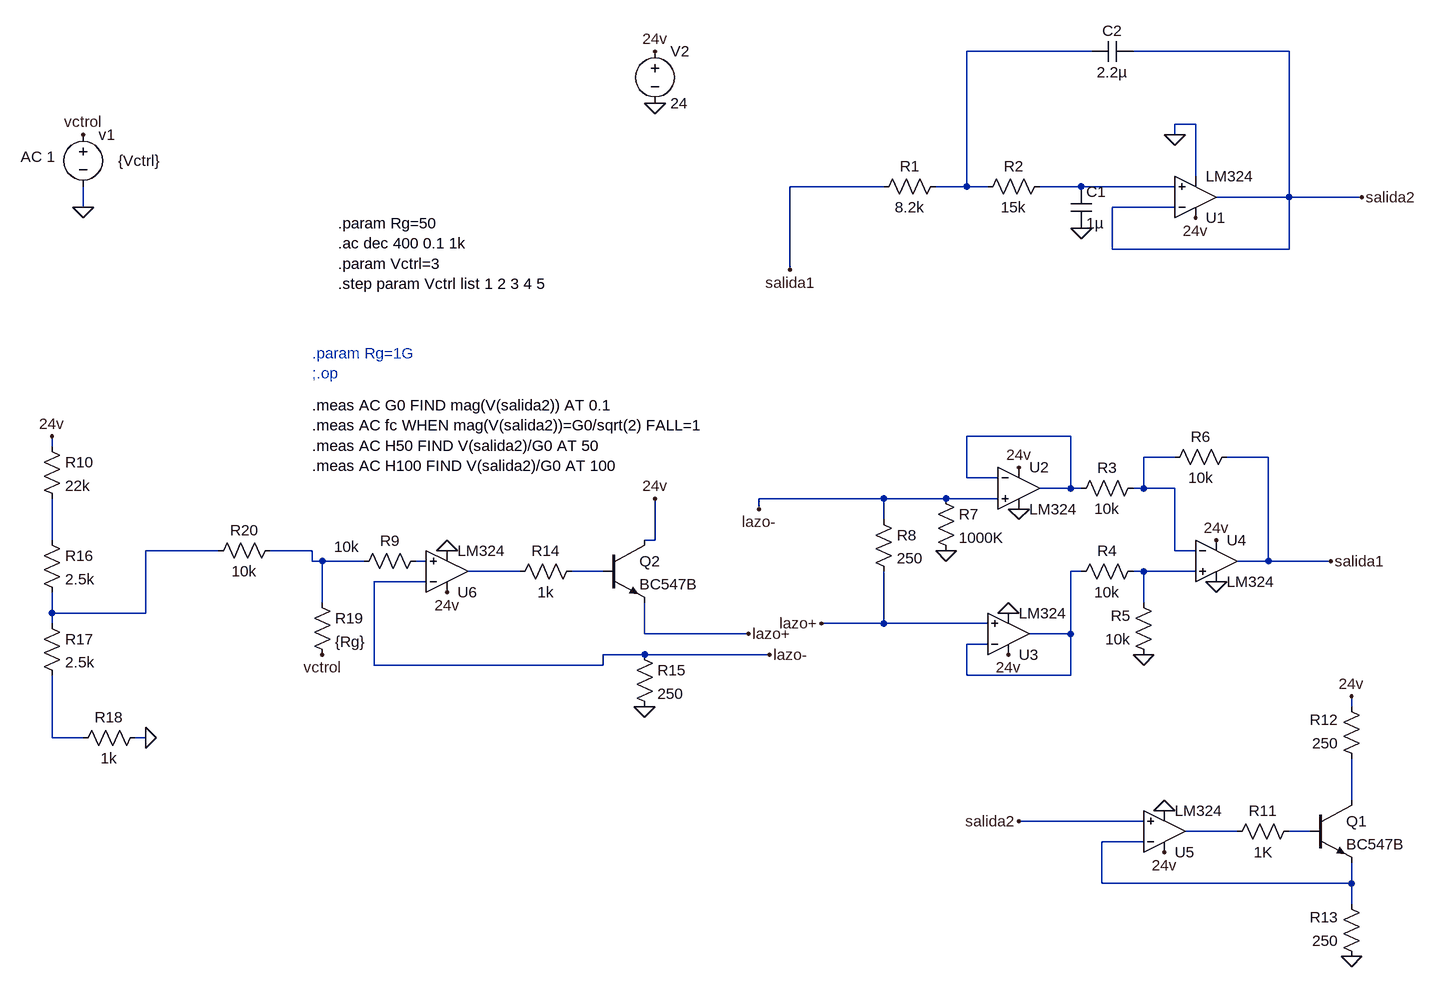
[diagram p0: schematic Filtro_Senal_Campo_Grupo2.asc]
Filtro_Senal_Campo_Grupo2.asc, the LTspice schematic file:
Version 4.1
SHEET 1 1044 1172
WIRE 528 -240 336 -240
WIRE 832 -240 592 -240
WIRE 688 -128 656 -128
WIRE 656 -112 656 -128
WIRE 688 -48 688 -128
WIRE 208 -32 64 -32
WIRE 336 -32 336 -240
WIRE 336 -32 288 -32
WIRE 368 -32 336 -32
WIRE 512 -32 448 -32
WIRE 656 -32 512 -32
WIRE 832 -16 832 -240
WIRE 832 -16 720 -16
WIRE 944 -16 832 -16
WIRE -1024 0 -1024 -32
WIRE 656 0 560 0
WIRE 560 64 560 0
WIRE 832 64 832 -16
WIRE 832 64 560 64
WIRE 64 96 64 -32
WIRE 496 352 336 352
WIRE -1072 368 -1072 352
WIRE 656 384 608 384
WIRE 800 384 736 384
WIRE 336 416 336 352
WIRE 384 416 336 416
WIRE 496 432 496 352
WIRE 496 432 448 432
WIRE 512 432 496 432
WIRE 608 432 608 384
WIRE 608 432 592 432
WIRE 656 432 608 432
WIRE 208 448 16 448
WIRE 304 448 208 448
WIRE 384 448 304 448
WIRE 16 464 16 448
WIRE 208 480 208 448
WIRE -1072 512 -1072 448
WIRE -144 512 -144 448
WIRE -144 512 -160 512
WIRE -816 528 -928 528
WIRE -672 528 -736 528
WIRE 656 528 656 432
WIRE 688 528 656 528
WIRE -672 544 -672 528
WIRE -656 544 -672 544
WIRE -592 544 -656 544
WIRE -496 544 -512 544
WIRE 800 544 800 384
WIRE 800 544 752 544
WIRE 896 544 800 544
WIRE -352 560 -432 560
WIRE -224 560 -272 560
WIRE 512 560 496 560
WIRE 608 560 592 560
WIRE 688 560 608 560
WIRE -496 576 -576 576
WIRE -656 608 -656 544
WIRE 608 608 608 560
WIRE -1072 624 -1072 592
WIRE -928 624 -928 528
WIRE -928 624 -1072 624
WIRE -1072 640 -1072 624
WIRE 208 640 208 560
WIRE 208 640 112 640
WIRE 368 640 208 640
WIRE -160 656 -160 608
WIRE 0 656 -160 656
WIRE 496 656 496 560
WIRE 496 656 432 656
WIRE 368 672 336 672
WIRE -160 688 -224 688
WIRE 32 688 -160 688
WIRE -576 704 -576 576
WIRE -224 704 -224 688
WIRE -224 704 -576 704
WIRE 336 720 336 672
WIRE 496 720 496 656
WIRE 496 720 336 720
WIRE 928 768 928 752
WIRE -1072 816 -1072 720
WIRE -1024 816 -1072 816
WIRE -928 816 -944 816
WIRE 928 912 928 848
WIRE 608 944 416 944
WIRE 752 960 672 960
WIRE 864 960 832 960
WIRE 608 976 544 976
WIRE 544 1040 544 976
WIRE 928 1040 928 1008
WIRE 928 1040 544 1040
WIRE 928 1072 928 1040
FLAG 512 32 0
FLAG 656 -112 0
FLAG -144 -160 0
FLAG -144 -240 24v
FLAG 688 16 24v
FLAG 304 528 0
FLAG 896 544 salida1
FLAG 944 -16 salida2
FLAG 416 400 24v
FLAG 400 688 24v
FLAG 720 512 24v
FLAG 416 464 0
FLAG 400 624 0
FLAG 720 576 0
FLAG 64 96 salida1
FLAG 608 688 0
FLAG 928 752 24v
FLAG 416 944 salida2
FLAG 928 1152 0
FLAG 640 928 0
FLAG 640 992 24v
FLAG -144 448 24v
FLAG -464 528 0
FLAG -464 592 24v
FLAG -160 768 0
FLAG 0 656 lazo+
FLAG 112 640 lazo+
FLAG 32 688 lazo-
FLAG 16 464 lazo-
FLAG -1024 0 0
FLAG -1024 -112 vctrol
FLAG -928 816 0
FLAG -1072 352 24v
FLAG -656 688 vctrol
SYMBOL res 304 -48 R90
WINDOW 0 0 56 VBottom 2
WINDOW 3 32 56 VTop 2
SYMATTR InstName R1
SYMATTR Value 8.2k
SYMBOL res 352 -16 R270
WINDOW 0 32 56 VTop 2
WINDOW 3 0 56 VBottom 2
SYMATTR InstName R2
SYMATTR Value 15k
SYMBOL cap 496 -32 R0
SYMATTR InstName C1
SYMATTR Value 1µ
SYMBOL cap 592 -256 R90
WINDOW 0 0 32 VBottom 2
WINDOW 3 32 32 VTop 2
SYMATTR InstName C2
SYMATTR Value 2.2µ
SYMBOL OpAmps\\LM324 688 48 M180
SYMATTR InstName U1
SYMBOL voltage -144 -256 R0
WINDOW 123 0 0 Left 0
WINDOW 39 0 0 Left 0
SYMATTR InstName V2
SYMATTR Value 24
SYMBOL OpAmps\\LM324 416 368 R0
SYMATTR InstName U2
SYMBOL OpAmps\\LM324 400 720 M180
SYMATTR InstName U3
SYMBOL OpAmps\\LM324 720 480 R0
SYMATTR InstName U4
SYMBOL res 608 416 R90
WINDOW 0 0 56 VBottom 2
WINDOW 3 32 56 VTop 2
SYMATTR InstName R3
SYMATTR Value 10k
SYMBOL res 608 544 R90
WINDOW 0 0 56 VBottom 2
WINDOW 3 32 56 VTop 2
SYMATTR InstName R4
SYMATTR Value 10k
SYMBOL res 624 704 R180
WINDOW 0 36 76 Left 2
WINDOW 3 36 40 Left 2
SYMATTR InstName R5
SYMATTR Value 10k
SYMBOL res 640 400 R270
WINDOW 0 32 56 VTop 2
WINDOW 3 0 56 VBottom 2
SYMATTR InstName R6
SYMATTR Value 10k
SYMBOL res 288 432 R0
SYMATTR InstName R7
SYMATTR Value 1000K
SYMBOL res 192 464 R0
SYMATTR InstName R8
SYMATTR Value 250
SYMBOL OpAmps\\LM324 640 1024 M180
SYMATTR InstName U5
SYMBOL res 848 944 R90
WINDOW 0 0 56 VBottom 2
WINDOW 3 32 56 VTop 2
SYMATTR InstName R11
SYMATTR Value 1K
SYMBOL res 944 864 R180
WINDOW 0 36 76 Left 2
WINDOW 3 36 40 Left 2
SYMATTR InstName R12
SYMATTR Value 250
SYMBOL res 944 1168 R180
WINDOW 0 36 76 Left 2
WINDOW 3 36 40 Left 2
SYMATTR InstName R13
SYMATTR Value 250
SYMBOL npn 864 912 R0
SYMATTR InstName Q1
SYMATTR Value BC547B
SYMBOL OpAmps\\LM324 -464 624 M180
SYMATTR InstName U6
SYMBOL res -256 544 R90
WINDOW 0 0 56 VBottom 2
WINDOW 3 32 56 VTop 2
SYMATTR InstName R14
SYMATTR Value 1k
SYMBOL npn -224 512 R0
SYMATTR InstName Q2
SYMATTR Value BC547B
SYMBOL res -176 672 R0
SYMATTR InstName R15
SYMATTR Value 250
SYMBOL voltage -1024 -128 R0
WINDOW 3 54 56 Left 2
WINDOW 123 -96 50 Left 2
WINDOW 39 0 0 Left 0
SYMATTR InstName v1
SYMATTR Value {Vctrl}
SYMATTR Value2 AC 1
SYMBOL res -496 528 R90
WINDOW 0 0 56 VBottom 2
WINDOW 3 -22 122 VTop 2
SYMATTR InstName R9
SYMATTR Value 10k
SYMBOL res -1088 352 R0
SYMATTR InstName R10
SYMATTR Value 22k
SYMBOL res -1088 496 R0
SYMATTR InstName R16
SYMATTR Value 2.5k
SYMBOL res -1088 624 R0
SYMATTR InstName R17
SYMATTR Value 2.5k
SYMBOL res -928 800 R90
WINDOW 0 0 56 VBottom 2
WINDOW 3 32 56 VTop 2
SYMATTR InstName R18
SYMATTR Value 1k
SYMBOL res -672 592 R0
SYMATTR InstName R19
SYMATTR Value {Rg}
SYMBOL res -720 512 R90
WINDOW 0 0 56 VBottom 2
WINDOW 3 32 56 VTop 2
SYMATTR InstName R20
SYMATTR Value 10k
TEXT -632 24 Left 2 !.param Rg=50\n.ac dec 400 0.1 1k\n.param Vctrl=3\n.step param Vctrl list 1 2 3 4 5
TEXT -672 304 Left 2 !.meas AC G0 FIND mag(V(salida2)) AT 0.1\n.meas AC fc WHEN mag(V(salida2))=G0/sqrt(2) FALL=1\n.meas AC H50 FIND V(salida2)/G0 AT 50\n.meas AC H100 FIND V(salida2)/G0 AT 100
TEXT -672 224 Left 2 ;.param Rg=1G\n;.op

The netlist it stands for:
* Filtro_Senal_Campo_Grupo2.asc
R1 N001 salida1 8.2k
R2 N001 N002 15k
C1 N002 0 1µ
C2 salida2 N001 2.2µ
X§U1 N002 salida2 24v 0 salida2 LM324  ; pins In+ In- V+ V- OUT
V2 24v 0 24
X§U2 lazo- N003 24v 0 N003 LM324  ; pins In+ In- V+ V- OUT
X§U3 lazo+ N011 24v 0 N011 LM324  ; pins In+ In- V+ V- OUT
X§U4 N012 N004 24v 0 salida1 LM324  ; pins In+ In- V+ V- OUT
R3 N004 N003 10k
R4 N012 N011 10k
R5 0 N012 10k
R6 N004 salida1 10k
R7 lazo- 0 1000K
R8 lazo- lazo+ 250
X§U5 salida2 N017 24v 0 N015 LM324  ; pins In+ In- V+ V- OUT
R11 N016 N015 1K
R12 N014 24v 250
R13 0 N017 250
Q1 N014 N016 N017 0 BC547B
X§U6 N008 lazo- 24v 0 N009 LM324  ; pins In+ In- V+ V- OUT
R14 N010 N009 1k
Q2 24v N010 lazo+ 0 BC547B
R15 lazo- 0 250
v1 vctrol 0 {Vctrl} AC 1
R9 N008 N007 10k
R10 24v N005 22k
R16 N005 N006 2.5k
R17 N006 N013 2.5k
R18 0 N013 1k
R19 N007 vctrol {Rg}
R20 N007 N006 10k
.model NPN NPN
.model PNP PNP
.lib standard.bjt
.param Rg=50
.ac dec 400 0.1 1k
.param Vctrl=3
.step param Vctrl list 1 2 3 4 5
.meas AC G0 FIND mag(V(salida2)) AT 0.1
.meas AC fc WHEN mag(V(salida2))=G0/sqrt(2) FALL=1
.meas AC H50 FIND V(salida2)/G0 AT 50
.meas AC H100 FIND V(salida2)/G0 AT 100
* .param Rg=1G
* ;.op
.backanno
.end